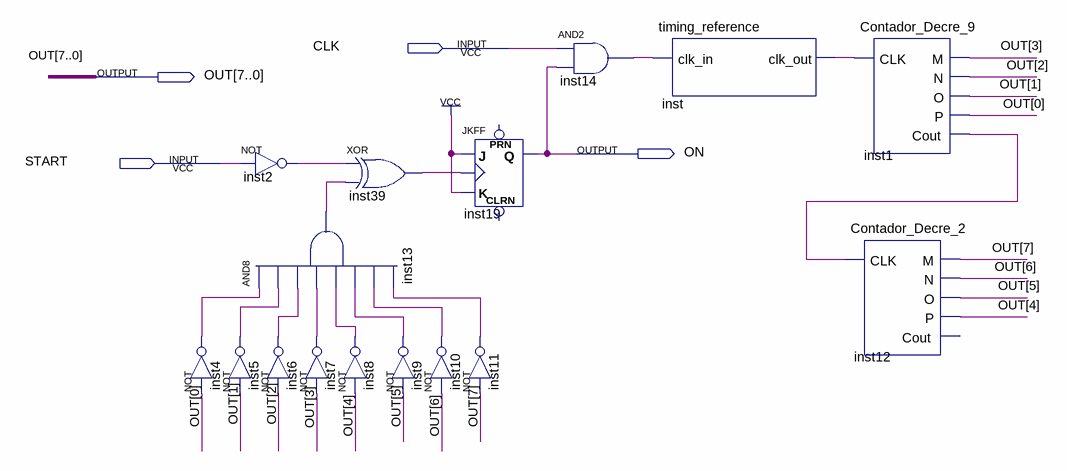
[diagram p0: schematic sheet]
// Quartus schematic Timer_30s.bdf as structural Verilog: 16 symbols, 4 pins
module Timer_30s (
  input  CLK,
  input  START,
  output [7:0] OUT,
  output ON
);

  wire inst1_cout, inst2_out, inst4_out, inst5_out, inst6_out, inst7_out, inst8_out, inst9_out, inst10_out,
       inst11_out, inst13_out, inst14_out, inst39_out, inst_clk_out;

  not inst2 (inst2_out, START);
  and inst13 (inst13_out, inst4_out, inst5_out, inst6_out, inst7_out, inst8_out, inst9_out, inst10_out, inst11_out);
  not inst4 (inst4_out, OUT[0]);
  not inst5 (inst5_out, OUT[1]);
  not inst6 (inst6_out, OUT[2]);
  not inst7 (inst7_out, OUT[3]);
  xor inst39 (inst39_out, inst2_out, inst13_out);
  not inst8 (inst8_out, OUT[4]);
  not inst9 (inst9_out, OUT[5]);
  JKFF inst19 (.K(1'b1), .J(1'b1), .CLK(inst39_out), .Q(ON));  // open: PRN, CLRN
  not inst10 (inst10_out, OUT[6]);
  not inst11 (inst11_out, OUT[7]);
  and inst14 (inst14_out, CLK, ON);
  timing_reference inst (.clk_in(inst14_out), .clk_out(inst_clk_out));
  Contador_Decre_9 inst1 (.CLK(inst_clk_out), .M(OUT[3]), .N(OUT[2]), .O(OUT[1]), .P(OUT[0]), .Cout(inst1_cout));
  Contador_Decre_2 inst12 (.CLK(inst1_cout), .M(OUT[7]), .N(OUT[6]), .O(OUT[5]), .P(OUT[4]));  // open: Cout
endmodule
